# Altium schematic sheet Driver.SchDoc
size A4; DocumentNumber: 1; SheetNumber: 2; SheetTotal: 8
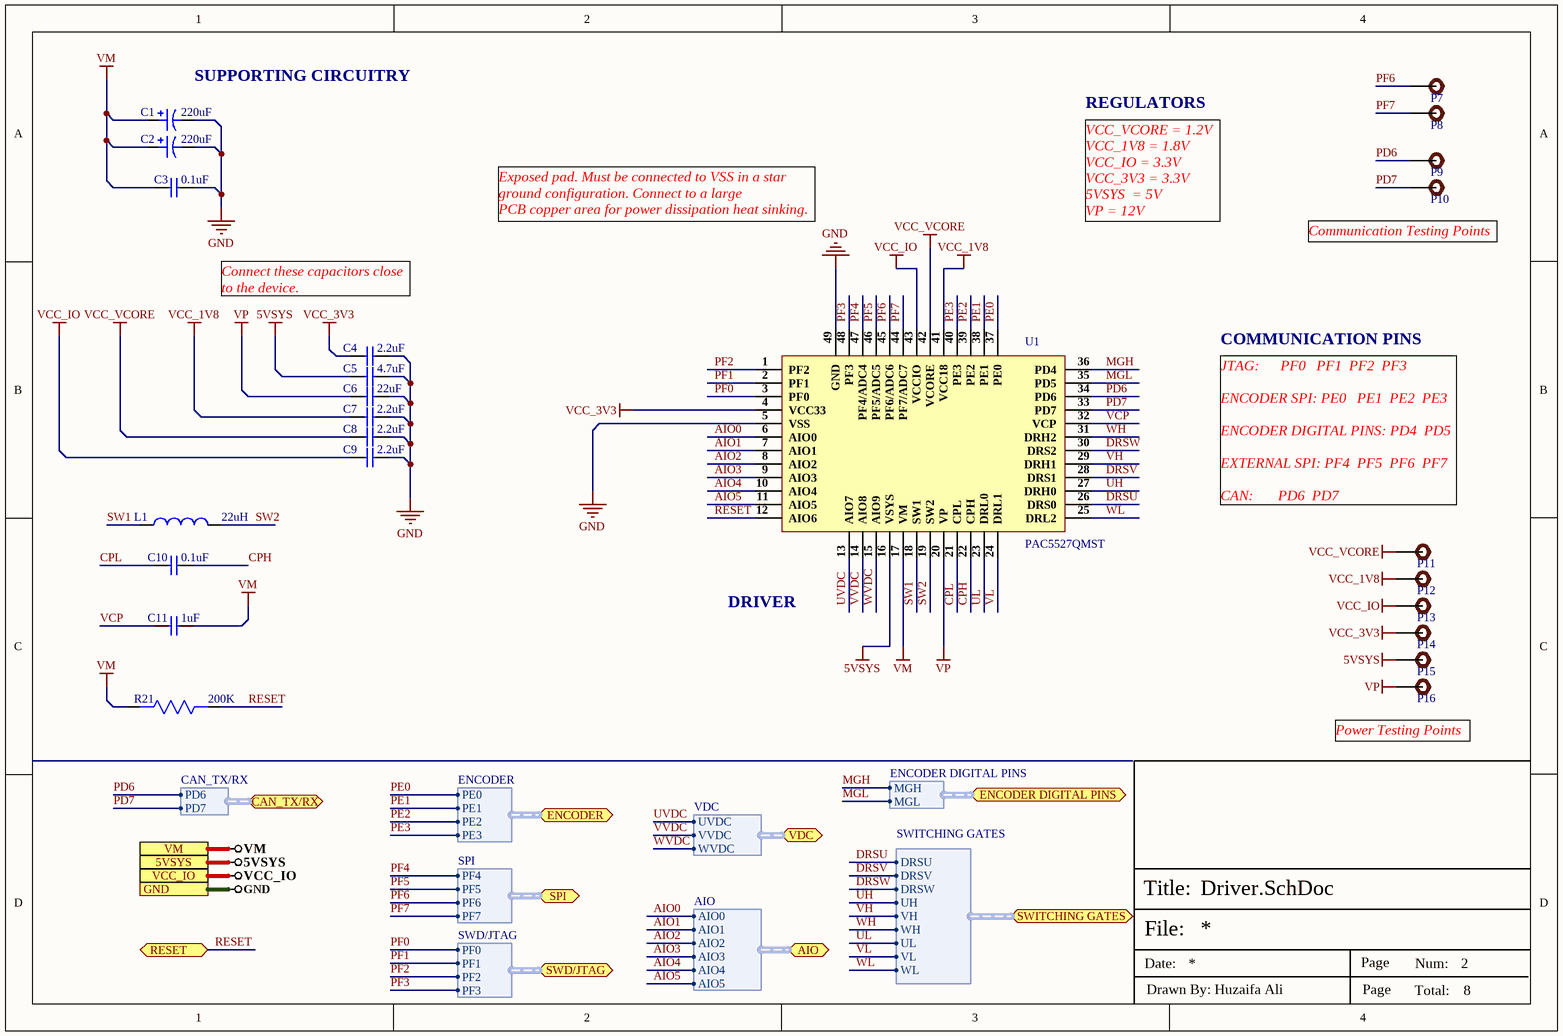
[diagram p0: Driver.SchDoc]

## Parts
C1  220uF  [UCD-220uF-10mmDia]
C2  220uF  [UCD-220uF-10mmDia]
C3  0.1uF  [Cap-0402]
C4  2.2uF  [Cap-0402]
C5  4.7uF  [Cap-0402]
C6  22uF  [Cap-0805]
C7  2.2uF  [Cap-0402]
C8  2.2uF  [Cap-0402]
C9  2.2uF  [Cap-0402]
C10  0.1uF  [Cap-0402]
C11  1uF  [Cap-0603]
L1  22uH  [SLF7045T- 220MR90-PF]
P7  TEST POINT  [Test-point]  (value not drawn)
P8  TEST POINT  [Test-point]  (value not drawn)
P9  TEST POINT  [Test-point]  (value not drawn)
P10  TEST POINT  [Test-point]  (value not drawn)
P11  TEST POINT  [Test-point]  (value not drawn)
P12  TEST POINT  [Test-point]  (value not drawn)
P13  TEST POINT  [Test-point]  (value not drawn)
P14  TEST POINT  [Test-point]  (value not drawn)
P15  TEST POINT  [Test-point]  (value not drawn)
P16  TEST POINT  [Test-point]  (value not drawn)
R21  200K  [Res-0603]
U1  PAC5527QMST  [48-QFN (6x6)_]

## Ports
5VSYS, AIO (bidir, harness AIO), CAN_TX/RX (bidir, harness CAN_TX/RX), ENCODER (bidir, harness ENCODER), ENCODER DIGITAL PINS (bidir, harness ENCODER DIGITAL PINS), GND, RESET (bidir), SPI (bidir, harness SPI), SWD/JTAG (bidir, harness SWD/JTAG), SWITCHING GATES (bidir, harness SWITCHING GATES), VCC_IO, VDC (bidir, harness VDC), VM

## Harnesses
SWITCHING GATES: DRSW, VL, DRSV, UH, DRSU, WL, VH, WH, UL
AIO: AIO0, AIO1, AIO2, AIO3, AIO4, AIO5
SWD/JTAG: PF0, PF1, PF2, PF3
CAN_TX/RX: PD6, PD7
VDC: UVDC, VVDC, WVDC
SPI: PF4, PF5, PF6, PF7
ENCODER: PE0, PE1, PE2, PE3
ENCODER DIGITAL PINS: MGH, MGL

## Nets
5VSYS: C5.1 P15.1 U1.16(VSYS) ; port 5VSYS
GND: C1.2 C2.2 C3.2 C4.2 C5.2 C6.2 C7.2 C8.2 C9.2 U1.5(VSS) U1.49(GND) ; port GND
VCC_1V8: C7.1 P12.1 U1.41(VCC18)
VCC_3V3: C4.1 P14.1 U1.4(VCC33)
VCC_IO: C9.1 P13.1 U1.43(VCCIO) ; port VCC_IO
VCC_VCORE: C8.1 P11.1 U1.42(VCORE)
VM: C1.1 C2.1 C3.1 C11.2 R21.1 U1.17(VM) ; port VM
VP: C6.1 P16.1 U1.20(VP)
AIO0: U1.6(AIO0) ; port AIO.AIO0
AIO1: U1.7(AIO1) ; port AIO.AIO1
AIO2: U1.8(AIO2) ; port AIO.AIO2
AIO3: U1.9(AIO3) ; port AIO.AIO3
AIO4: U1.10(AIO4) ; port AIO.AIO4
AIO5: U1.11(AIO5) ; port AIO.AIO5
CPH: C10.2 U1.22(CPH)
CPL: C10.1 U1.21(CPL)
DRSU: U1.26(DRS0) ; port SWITCHING GATES.DRSU
DRSV: U1.28(DRS1) ; port SWITCHING GATES.DRSV
DRSW: U1.30(DRS2) ; port SWITCHING GATES.DRSW
MGH: U1.36(PD4) ; port ENCODER DIGITAL PINS.MGH
MGL: U1.35(PD5) ; port ENCODER DIGITAL PINS.MGL
PD6: P9.1 U1.34(PD6) ; port CAN_TX/RX.PD6
PD7: P10.1 U1.33(PD7) ; port CAN_TX/RX.PD7
PE0: U1.37(PE0) ; port ENCODER.PE0
PE1: U1.38(PE1) ; port ENCODER.PE1
PE2: U1.39(PE2) ; port ENCODER.PE2
PE3: U1.40(PE3) ; port ENCODER.PE3
PF0: U1.3(PF0) ; port SWD/JTAG.PF0
PF1: U1.2(PF1) ; port SWD/JTAG.PF1
PF2: U1.1(PF2) ; port SWD/JTAG.PF2
PF3: U1.48(PF3) ; port SWD/JTAG.PF3
PF4: U1.47(PF4/ADC4) ; port SPI.PF4
PF5: U1.46(PF5/ADC5) ; port SPI.PF5
PF6: P7.1 U1.45(PF6/ADC6) ; port SPI.PF6
PF7: P8.1 U1.44(PF7/ADC7) ; port SPI.PF7
RESET: R21.2 U1.12(AIO6) ; port RESET
SW1: L1.1 U1.18(SW1)
SW2: L1.2 U1.19(SW2)
UH: U1.27(DRH0) ; port SWITCHING GATES.UH
UL: U1.23(DRL0) ; port SWITCHING GATES.UL
UVDC: U1.13(AIO7) ; port VDC.UVDC
VCP: C11.1 U1.32(VCP)
VH: U1.29(DRH1) ; port SWITCHING GATES.VH
VL: U1.24(DRL1) ; port SWITCHING GATES.VL
VVDC: U1.14(AIO8) ; port VDC.VVDC
WH: U1.31(DRH2) ; port SWITCHING GATES.WH
WL: U1.25(DRL2) ; port SWITCHING GATES.WL
WVDC: U1.15(AIO9) ; port VDC.WVDC

## Notes on the sheet
- (near C1) SUPPORTING CIRCUITRY
- REGULATORS
- Exposed pad. Must be connected to VSS in a star ground configuration. Connect to a large
  PCB copper area for power dissipation heat sinking.
- VCC_VCORE = 1.2V
  VCC_1V8 = 1.8V
  VCC_IO = 3.3V
  VCC_3V3 = 3.3V
  5VSYS  = 5V
  VP = 12V
- (near P10) Communication Testing Points
- Connect these capacitors close to the device.
- COMMUNICATION PINS
- JTAG:      PF0   PF1  PF2  PF3
  ENCODER SPI: PE0   PE1  PE2  PE3
  ENCODER DIGITAL PINS: PD4  PD5
  EXTERNAL SPI: PF4  PF5  PF6  PF7
  CAN:       PD6  PD7
- DRIVER
- (near P16) Power Testing Points
- File:
- Title:
- Date:
- Page
- Num:
- Total:
- Drawn By: Huzaifa Ali

## Library data of the parts
C1 C2 = UCD1H221MNL1GS: CAP ALUM 220UF 20% 50V SMD; Manufacturer: Nichicon; Ripple Current: 700mA; Impedance: 160mR; Leakage Current: 3uA; Life (Hours): 5000Hour; Dissipation Factor: 0.1%; Supplier 1: Digi-Key; Manufacturer Part Number: UCD1H221MNL1GS; RoHS: Yes; Category: Aluminum Electrolytic Capacitors; Pricing 1: 1=0.85000, 10=0.60200, 50=0.45480, 100=0.39620 (USD); Mount: Surface Mount,PCB; Case/Package: Radial; Min Operating Temperature: -55°C; Max Operating Temperature: 105°C; Capacitance: 220uF; Tolerance: 20%; Voltage Rating: 50V; Packaging: Tape and Reel; Package Quantity: 1; Voltage Rating (DC): 50V; Termination: SMD/SMT; Voltage: 50V; Features: General Purpose; Series: CD; Construction: Cylindrical; Diameter: 10mm; Length: 10mm; Height: 10mm; Height - Seated (Max): 0.394inch; Radiation Hardening: No; Lead Free: Lead Free; RoHS Compliant: Yes; ComponentLink1URL: https://datasheet.ciiva.com/11776/0900766b80ebdadd-11776792.pdf?src-supplier=RSComponents; ComponentLink1Description: https://datasheet.ciiva.com/11776/0900766b80ebdadd-11776792.pdf?src-supplier=RSComponents; ComponentLink2URL: https://datasheet.ciiva.com/5362/e-cd-22158-5362489.pdf?src-supplier=Mouser; ComponentLink2Description: https://datasheet.ciiva.com/5362/e-cd-22158-5362489.pdf?src-supplier=Mouser; ComponentLink3URL: https://datasheet.ciiva.com/11684/e-cd-11684678.pdf?src-supplier=Avnet; ComponentLink3Description: https://datasheet.ciiva.com/11684/e-cd-11684678.pdf?src-supplier=Avnet; ComponentLink4URL: https://datasheet.ciiva.com/15037/e-cd-15037119.pdf?src-supplier=Digi-Key; ComponentLink4Description: https://datasheet.ciiva.com/15037/e-cd-15037119.pdf?src-supplier=Digi-Key; ComponentLink5URL: https://datasheet.ciiva.com/16393/e-cd-16393493.pdf?src-supplier=Future+Electronics; ComponentLink5Description: https://datasheet.ciiva.com/16393/e-cd-16393493.pdf?src-supplier=Future+Electronics; ComponentLink6URL: https://datasheet.ciiva.com/17354/e-cd-17354606.pdf?src-supplier=Avnet+Europe; ComponentLink6Description: https://datasheet.ciiva.com/17354/e-cd-17354606.pdf?src-supplier=Avnet+Europe; Supplier Part Number 1: 493-6390-1-ND; LCSC Part Number: C116211
C3 C10 = GRM155R62A104KE14D: CAP CER 0.1UF 100V X5R 0402; Manufacturer: Murata; Capacitance: 100nF; Tolerance: 10%; Item Type: Capacitor; Supplier 1: Arrow Electronics; Manufacturer Part Number: GRM155R62A104KE14D; RoHS: Yes; Category: Ceramic Capacitors; Stock 1: 870000; Pricing 1: 10000=0.00500, 20000=0.00410, 30000=0.00390, 50000=0.00370, 100000=0.00300 (USD); Mount: Surface Mount; Case/Package: 0402; Case Code (Metric): 1005; Case Code (Imperial): 0402; Weight: 0.000212oz; Min Operating Temperature: -55°C; Max Operating Temperature: 85°C; Packaging: Tape and Reel; Voltage Rating: 100V; Dielectric: X5R; Termination: SMD/SMT; Voltage Rating (DC): 100V; Package Quantity: 10000; Series: GRM; Length: 0.039inch; Width: 0.02inch; Height: 0.5mm; Thickness: 0.022inch; Reach SVHC Compliant: Yes; Lead Free: Lead Free; RoHS Compliant: Yes; ComponentLink1URL: http://www.farnell.com/datasheets/2079151.pdf?src-supplier=Farnell; ComponentLink1Description: http://www.farnell.com/datasheets/2079151.pdf?src-supplier=Farnell; ComponentLink2URL: http://www.mouser.com/ds/2/281/c02e-2905.pdf?src-supplier=Mouser; ComponentLink2Description: http://www.mouser.com/ds/2/281/c02e-2905.pdf?src-supplier=Mouser; ComponentLink3URL: http://www.farnell.com/datasheets/2079151.pdf?src-supplier=Element14; ComponentLink3Description: http://www.farnell.com/datasheets/2079151.pdf?src-supplier=Element14; ComponentLink4URL: http://search.murata.co.jp/Ceramy/image/img/A01X/G101/ENG/GRM155R62A104KE14-01.pdf?src-supplier=Digi-Key; ComponentLink4Description: http://search.murata.co.jp/Ceramy/image/img/A01X/G101/ENG/GRM155R62A104KE14-01.pdf?src-supplier=Digi-Key; ComponentLink5URL: http://www.farnell.com/datasheets/2079151.pdf?src-supplier=Newark; ComponentLink5Description: http://www.farnell.com/datasheets/2079151.pdf?src-supplier=Newark; Supplier Part Number 1: GRM155R62A104KE14D; LCSC Part Number: C162178
C4 C7-C9 = GRM155R61E225KE11D: CAP CER 2.2UF 25V X5R 0402; Manufacturer: Murata; Material: Ceramic; Tolerance: 10%; Item Type: Capacitor; Supplier 1: Avnet; Manufacturer Part Number: GRM155R61E225KE11D; RoHS: Yes; Category: Ceramic Capacitors; Stock 1: 210000; Pricing 1: 10000=0.03830, 20000=0.03623, 40000=0.03416, 60000=0.03209, 80000=0.03002, 100000=0.02795, 1000000=0.02588 (USD); Mount: Surface Mount; Case/Package: 0402; Case Code (Metric): 1005; Case Code (Imperial): 0402; Weight: 0.000212oz; Min Operating Temperature: -55°C; Max Operating Temperature: 85°C; Dielectric: X5R; Capacitance: 2.2uF; Packaging: Tape and Reel; Voltage Rating: 25V; Termination: SMD/SMT; Resistor Type: Ceramic; Voltage Rating (DC): 25V; Package Quantity: 10000; Length: 1mm; Width: 0.5mm; Height: 0.5mm; Thickness: 0.022inch; Lead Free: Lead Free; RoHS Compliant: Yes; ComponentLink1URL: http://www.mouser.com/ds/2/281/c02e-2905.pdf?src-supplier=Mouser; ComponentLink1Description: http://www.mouser.com/ds/2/281/c02e-2905.pdf?src-supplier=Mouser; ComponentLink2URL: http://search.murata.co.jp/Ceramy/image/img/A01X/G101/ENG/GRM155R61E225KE11-01.pdf?src-supplier=Digi-Key; ComponentLink2Description: http://search.murata.co.jp/Ceramy/image/img/A01X/G101/ENG/GRM155R61E225KE11-01.pdf?src-supplier=Digi-Key; ComponentLink3URL: http://search.murata.co.jp/Ceramy/image/img/A01X/partnumbering_e_01.pdf?src-supplier=Digi-Key; ComponentLink3Description: http://search.murata.co.jp/Ceramy/image/img/A01X/partnumbering_e_01.pdf?src-supplier=Digi-Key; ComponentLink4URL: http://psearch.en.murata.com/capacitor/product/GRM155R61E225KE11%23.pdf?src-supplier=Avnet; ComponentLink4Description: http://psearch.en.murata.com/capacitor/product/GRM155R61E225KE11%23.pdf?src-supplier=Avnet; Supplier Part Number 1: GRM155R61E225KE11D; LCSC Part Number: C385032
C5 = EDK105BBJ475MVLF: CAP CER 4.7UF 50V 0402; Manufacturer: Taiyo Yuden; Item Type: Capacitor; Manufacturer Part Number: EDK105BBJ475MVLF; LCSC Part Number: C412302; ComponentLink1Description: LCSC; ComponentLink1URL: https://www.lcsc.com/product-detail/Multilayer-Ceramic-Capacitors-MLCC-SMD-SMT_Taiyo-Yuden-EDK105BBJ475MVLF_C412302.html
C6 = CL21A226MAYNNNE: CAP CER 22UF 25V X5R 0805; Manufacturer: Samsung; Supplier 1: Mouser; Manufacturer Part Number: CL21A226MAYNNNE; RoHS: Yes; Category: Ceramic Capacitors; Stock 1: 1240410; Pricing 1: 1=0.28000, 10=0.18500, 50=0.18500, 100=0.10600, 500=0.07500, 1000=0.06400, 2000=0.06100, 10000=0.05400, 24000=0.05100, 50000=0.04600 (USD); RoHS Compliant: Yes; Supplier Part Number 1: 187-CL21A226MAYNNNE; LCSC Part Number: C602037
C11 = UMK107AB7105KA-T: CAP CER 1UF 50V X7R 0603; Manufacturer: Taiyo Yuden; Tolerance: 10%; ComponentLink1URL: http://www.farnell.com/datasheets/2048165.pdf?src-supplier=Element14; ComponentLink1Description: http://www.farnell.com/datasheets/2048165.pdf?src-supplier=Element14; ComponentLink2URL: https://www.murata.com/~/media/webrenewal/support/library/catalog/products/capacitor/mlcc/c02e.ashx?la=en-us&src-supplier=Digi-Key; ComponentLink2Description: https://www.murata.com/~/media/webrenewal/support/library/catalog/products/capacitor/mlcc/c02e.ashx?la=en-us&src-supplier=Digi-Key; Supplier 1: Digi-Key; Manufacturer Part Number: UMK107AB7105KA-T; Stock 1: 453098; Pricing 1: 1=0.28, 10=0.19, 100=0.1079, 500=0.0762, 1000=0.0667 (USD); Mount: Surface Mount; Case/Package: 0603; Case Code (Metric): 1608; Case Code (Imperial): 0603; Min Operating Temperature: -55°C; Max Operating Temperature: 125°C; Packaging: Tape and Reel; Package Quantity: 1; Capacitance: 1uF; Voltage Rating: 50V; Voltage Rating (DC): 50V; Dielectric: X7R; Termination: SMD/SMT; Length: 1.6mm; Height: 0.8mm; Width: 0.031inch; Thickness: 0.037inch; Depth: 0.8mm; Radiation Hardening: No; Halogen Free: Halogen Free; ComponentLink3URL: https://www.yuden.co.jp/productdata/catalog/mlcc_all_e.pdf?src-supplier=Digi-Key; ComponentLink3Description: https://www.yuden.co.jp/productdata/catalog/mlcc_all_e.pdf?src-supplier=Digi-Key; ComponentLink4URL: https://www.yuden.co.jp/productdata/catalog/mlcc_all_e.pdf?src-supplier=Onlinecomponents.com; ComponentLink4Description: https://www.yuden.co.jp/productdata/catalog/mlcc_all_e.pdf?src-supplier=Onlinecomponents.com; Supplier Part Number 1: 587-3247-1-ND; LCSC Part Number: C105174
L1 = SLF7045T-220MR90-PF: FIXED IND 22UH 1.34A 73.2MOHM SM; Manufacturer: TDK; Core Material: Ferrite; Tolerance: 20%; Saturation Current: 900mA; Shielding: Shielded; DC Resistance (DCR): 61mR; Test Frequency: 100kHz; Item Type: Inductor; Supplier 1: RSComponents; Manufacturer Part Number: SLF7045T-220MR90-PF; RoHS: Yes; Category: Fixed Inductors; Stock 1: 650; Pricing 1: 10=0.64900, 100=0.61900, 500=0.49700, 1000=0.34500, 2500=0.32500 (GBP); Mount: Surface Mount; Case/Package: Nonstandard; Min Operating Temperature: -40°C; Max Operating Temperature: 85°C; Packaging: Tape and Reel; Inductance Tolerance: 20%; Package Quantity: 1; Current Rating: 1.34A; Resistor Type: Wirewound; Inductance: 22uH; Max DC Current: 900mA; Termination: SMD/SMT; RMS Current (Irms): 1.34A; DC Current: 1.34A; Series: SLF; Rated Current-Max: 900mA; Length: 0.276inch; Width: 0.276inch; Height: 4.5mm; Height - Seated (Max): 0.189inch; Depth: 7.2mm; Radiation Hardening: No; Reach SVHC Compliant: Yes; Military Standard: Not; Lead Free: Lead Free; RoHS Compliant: Yes; ComponentLink1URL: https://datasheet.ciiva.com/3866/84print-detail-pdf-phplangenpart-noslf7045t-220mr90-pfnreimp-unit-x-3866590.pdf?src-supplier=Arrow+Electronics; ComponentLink1Description: https://datasheet.ciiva.com/3866/84print-detail-pdf-phplangenpart-noslf7045t-220mr90-pfnreimp-unit-x-3866590.pdf?src-supplier=Arrow+Electronics; LCSC Part Number: C13754; Supplier Part Number 1: 9164248
P7-P16 = TEST POINT: Test Point ON
R21 = RT0603DRD07200KL: RES SMD 200K OHM 0.5% 1/10W 0603; Manufacturer: Yageo; Voltage Rating: 75V; Resistance: 200kR; Power Rating: 100mW; Temperature Coefficient: 25ppm/°C; Voltage Rating (DC): 50V; Supplier 1: Digi-Key; Manufacturer Part Number: RT0603DRD07200KL; Stock 1: 88258; Pricing 1: 1=0.21, 10=0.174, 100=0.0682, 1000=0.02855, 2500=0.02617 (USD); Case/Package: 0603; Case Code (Metric): 1608; Case Code (Imperial): 0603; Min Operating Temperature: -55°C; Max Operating Temperature: 125°C; Tolerance: 0.5%; Packaging: Tape and Reel; Termination: SMD/SMT; Lead Free: Lead Free; Supplier Part Number 1: 311-200KDCT-ND; LCSC Part Number: C136943
U1 = PAC5527QMST: PAC5527 48V BLDC Motor Controller and Driver Evaluation Board; Manufacturer: Qorvo; Item Type: IC; Supplier 1: Avnet; Manufacturer Part Number: PAC5527QMST; RoHS: No; Pricing 1: 100=4.78000 (USD); Supplier Part Number 1: PAC5527QMST; Supplier 2: Mouser; Category: Uncategorized; Stock 2: 1; Pricing 2: 1=156.25000, 10=156.25000, 50=156.25000, 100=156.25000, 1000=156.25000, 10000=156.25000 (USD); Supplier Part Number 2: 107-PAC5527EVK1